# Altium schematic sheet Power-Sheet-v1.1.SchDoc
size 420 x 297 mm; SheetNumber: 1; SheetTotal: 1
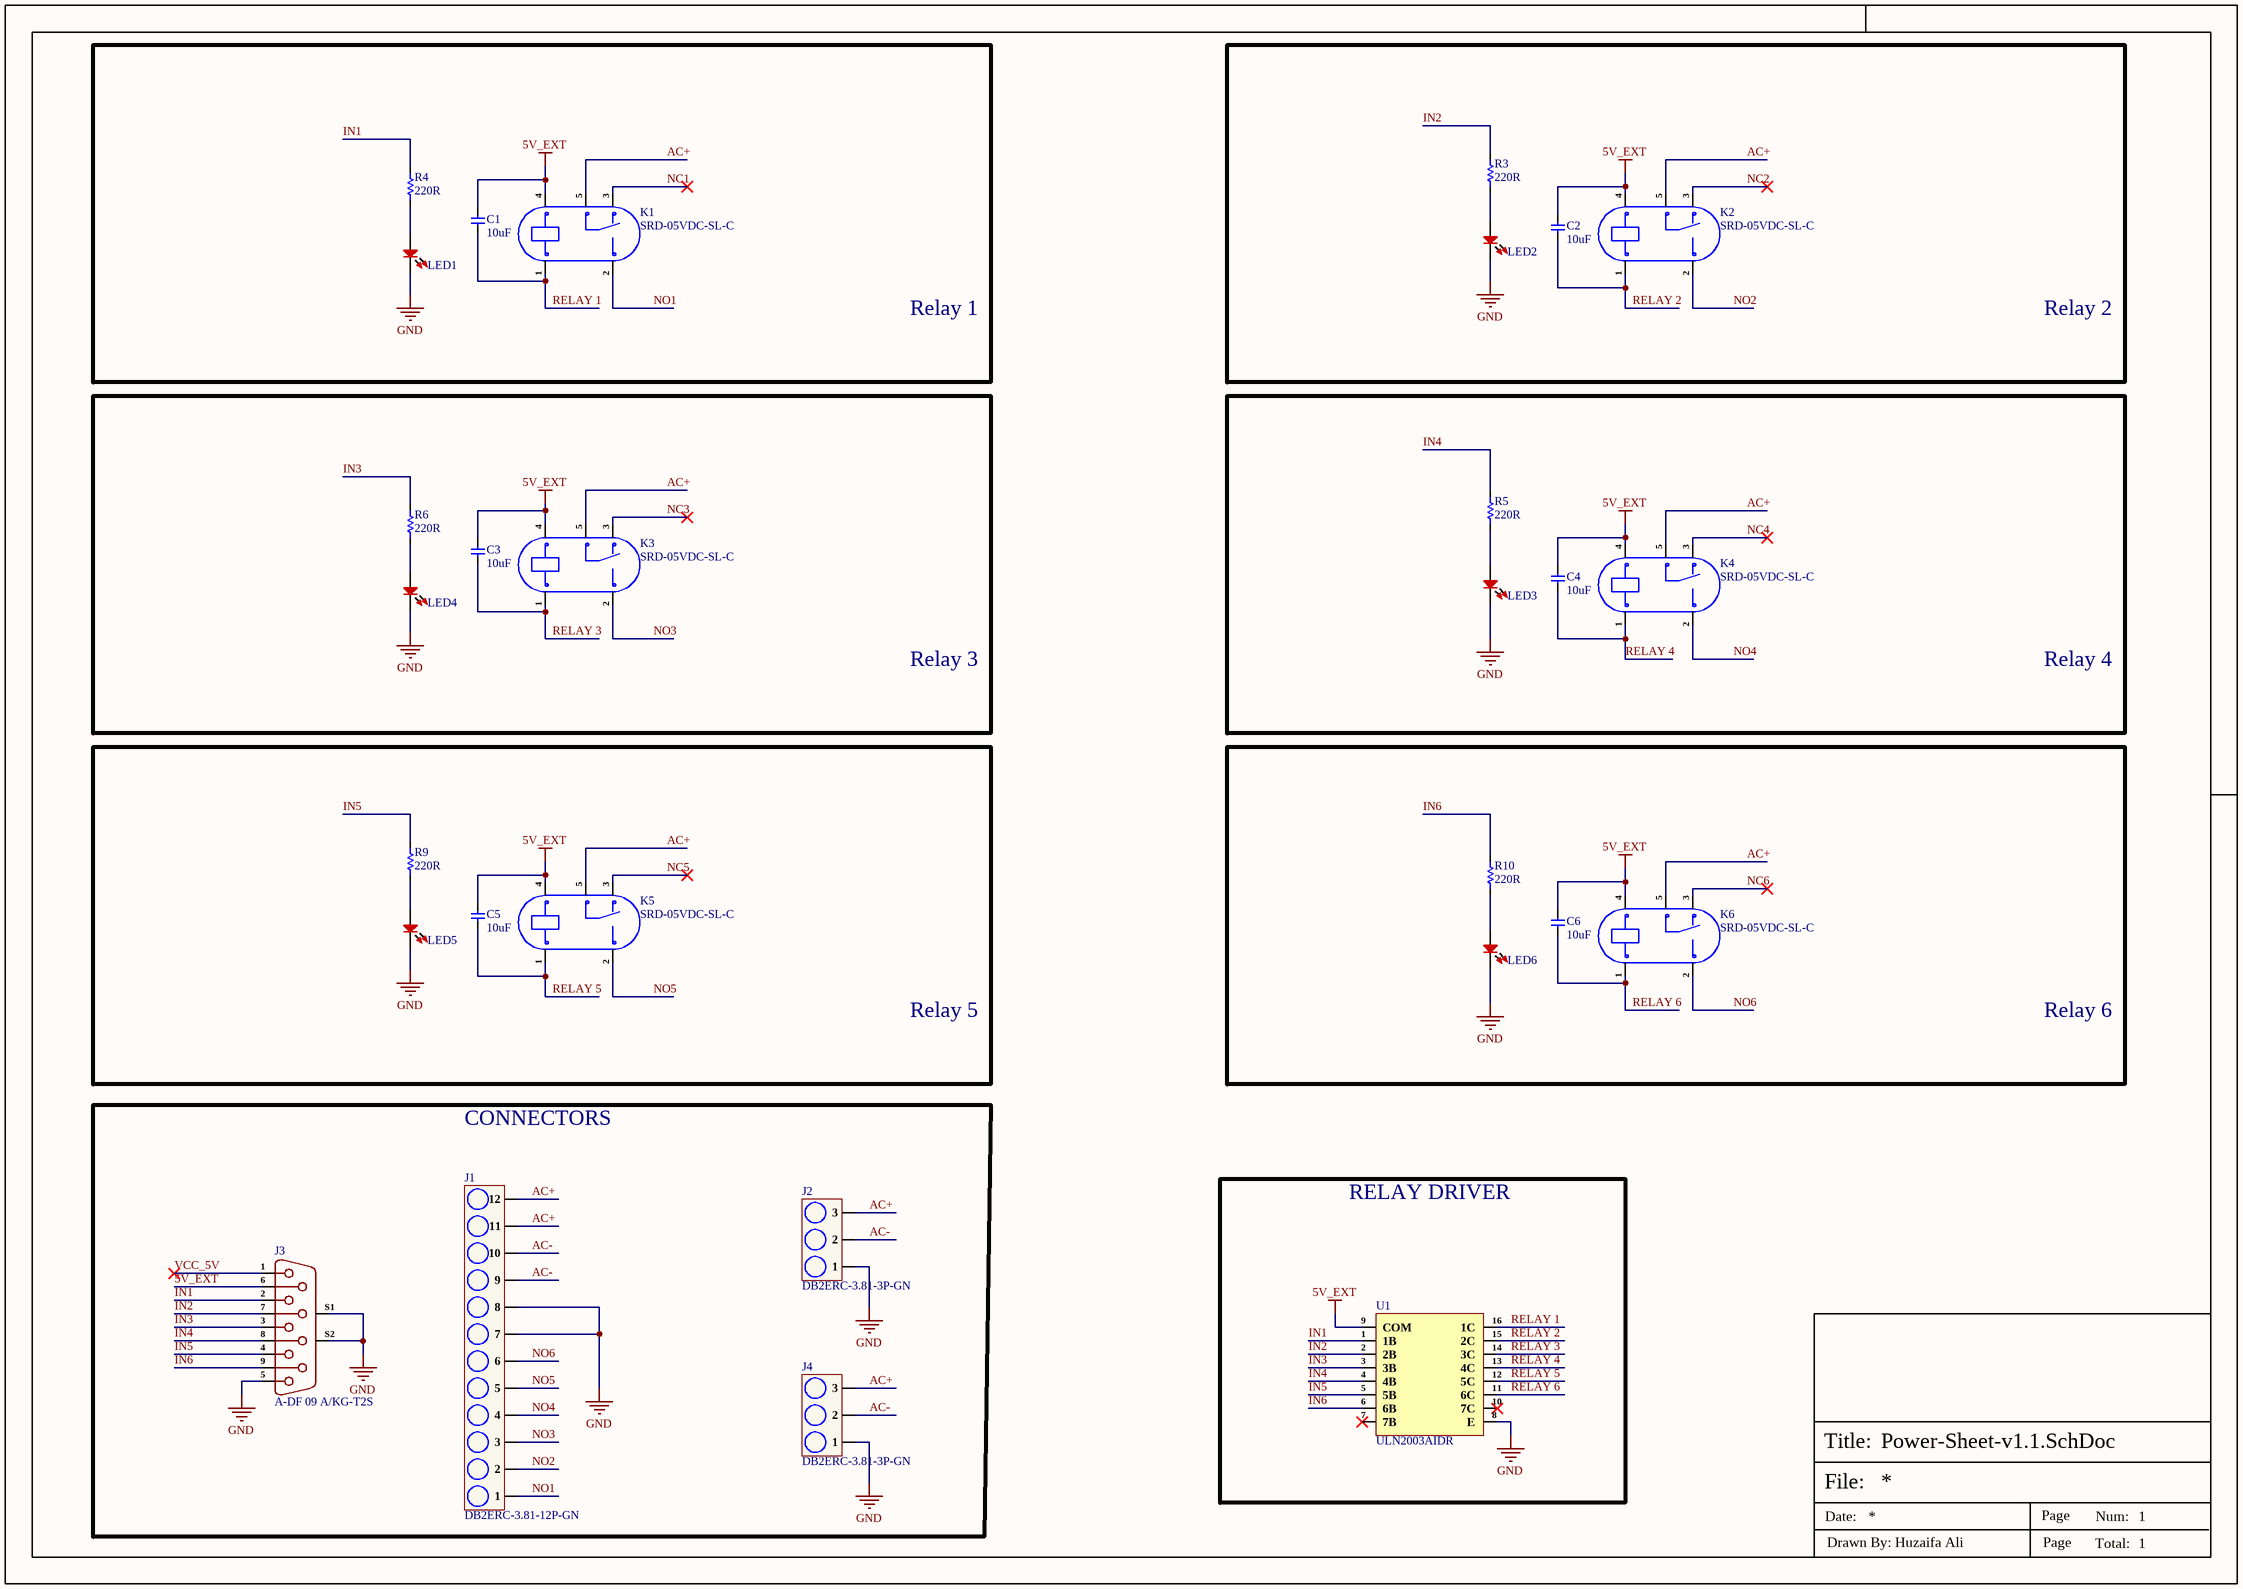
[diagram p0: Power-Sheet-v1.1.SchDoc]

## Parts
C1  10uF  [Cap-0805]
C2  10uF  [Cap-0805]
C3  10uF  [Cap-0805]
C4  10uF  [Cap-0805]
C5  10uF  [Cap-0805]
C6  10uF  [Cap-0805]
J1  DB2ERC-3.81-12P-GN  [DB2ERC-3.81-12P-GN]
J2  DB2ERC-3.81-3P-GN  [DB2ERC-3.81-3P-GN]
J3  A-DF 09 A/KG-T2S  [A-DF 09 A/KG-T2S]
J4  DB2ERC-3.81-3P-GN  [DB2ERC-3.81-3P-GN]
K1  SRD-05VDC-SL-C  [SRD-05VDC-SL-C]
K2  SRD-05VDC-SL-C  [SRD-05VDC-SL-C]
K3  SRD-05VDC-SL-C  [SRD-05VDC-SL-C]
K4  SRD-05VDC-SL-C  [SRD-05VDC-SL-C]
K5  SRD-05VDC-SL-C  [SRD-05VDC-SL-C]
K6  SRD-05VDC-SL-C  [SRD-05VDC-SL-C]
LED1  LTST-C193KRKT-5A  [LED-0603]  (value not drawn)
LED2  LTST-C193KRKT-5A  [LED-0603]  (value not drawn)
LED3  LTST-C193KRKT-5A  [LED-0603]  (value not drawn)
LED4  LTST-C193KRKT-5A  [LED-0603]  (value not drawn)
LED5  LTST-C193KRKT-5A  [LED-0603]  (value not drawn)
LED6  LTST-C193KRKT-5A  [LED-0603]  (value not drawn)
R3  220R  [Res-0603]
R4  220R  [Res-0603]
R5  220R  [Res-0603]
R6  220R  [Res-0603]
R9  220R  [Res-0603]
R10  220R  [Res-0603]
U1  ULN2003AIDR  [16-SOIC (0.154", 3.90mm Width)]

## Blocks framed on the sheet
Relay 1: C1 K1 LED1 R4
Relay 2: C2 K2 LED2 R3
Relay 3: C3 K3 LED4 R6
Relay 4: C4 K4 LED3 R5
Relay 5: C5 K5 LED5 R9
Relay 6: C6 K6 LED6 R10
CONNECTORS: J1-J4
RELAY DRIVER: U1

## Nets
5V_EXT: C1.2 C2.2 C3.2 C4.2 C5.2 C6.2 J3.6 K1.4 K2.4 K3.4 K4.4 K5.4 K6.4 U1.9(COM)
GND: J1.7 J1.8 J2.1 J3.5 J3.S1 J3.S2 J4.1 LED1.2 LED2.2 LED3.2 LED4.2 LED5.2 LED6.2 U1.8(E)
AC+: J1.11 J1.12 J2.3 J4.3 K1.5 K2.5 K3.5 K4.5 K5.5 K6.5
AC-: J1.9 J1.10 J2.2 J4.2
IN1: J3.2 R4.2 U1.1(1B)
IN2: J3.7 R3.2 U1.2(2B)
IN3: J3.3 R6.2 U1.3(3B)
IN4: J3.8 R5.2 U1.4(4B)
IN5: J3.4 R9.2 U1.5(5B)
IN6: J3.9 R10.2 U1.6(6B)
NC1: K1.3
NC2: K2.3
NC3: K3.3
NC4: K4.3
NC5: K5.3
NC6: K6.3
NO1: J1.1 K1.2
NO2: J1.2 K2.2
NO3: J1.3 K3.2
NO4: J1.4 K4.2
NO5: J1.5 K5.2
NO6: J1.6 K6.2
RELAY 1: C1.1 K1.1 U1.16(1C)
RELAY 2: C2.1 K2.1 U1.15(2C)
RELAY 3: C3.1 K3.1 U1.14(3C)
RELAY 4: C4.1 K4.1 U1.13(4C)
RELAY 5: C5.1 K5.1 U1.12(5C)
RELAY 6: C6.1 K6.1 U1.11(6C)
VCC_5V: J3.1
NetLED1_1: LED1.1 R4.1
NetLED2_1: LED2.1 R3.1
NetLED3_1: LED3.1 R5.1
NetLED4_1: LED4.1 R6.1
NetLED5_1: LED5.1 R9.1
NetLED6_1: LED6.1 R10.1

Not connected (* = marked no-connect by the designer): U1 7(7B)* 10(7C)*

## Notes on the sheet
- File:
- Title:
- Date:
- Page
- Num:
- Total:
- Drawn By: Huzaifa Ali

## Library data of the parts
C1-C6 = GRM21BR61H106ME43L: CAP CER 10UF 50V X5R 0805; Manufacturer: Murata; Supplier 1: Digi-Key; Manufacturer Part Number: GRM21BR61H106ME43L; RoHS: Yes; Category: Ceramic Capacitors; Stock 1: 26; Pricing 1: 1=0.44000, 10=0.30700, 50=0.21500, 100=0.18420, 500=0.13818, 1000=0.11668 (USD); Supplier Part Number 1: 490-18664-1-ND; LCSC Part Number: C2190942
J1 = DB2ERC-3.81-12P-GN: 250V 10A 12 Bend -40℃~+105℃ 1 3.81mm 1x12P Green Board Edge/Receptacle-Close Push-Pull,P=3.81mm Pluggable System Terminal Block ROHS; Manufacturer: DORABO; Manufacturer Part Number: DB2ERC-3.81-12P-GN; Package: Push-Pull,P=3.81mm; LCSC Part Number: C395728; Item Type: Terminal Block; ComponentLink1Description: LCSC; ComponentLink1URL: https://www.lcsc.com/product-detail/Pluggable-System-Terminal-Block_DORABO-DB2ERC-3-81-12P-GN_C395728.html
J2 J4 = DB2ERC-3.81-3P-GN: 250V 10A 3 Bend -40℃~+105℃ 1 3.81mm 1x3P Green Board Edge/Receptacle-Close Push-Pull,P=3.81mm Pluggable System Terminal Block ROHS; Manufacturer: DORABO; Manufacturer Part Number: DB2ERC-3.81-3P-GN; Package: Push-Pull,P=3.81mm; LCSC Part Number: C395690; Item Type: Terminal Block; ComponentLink1Description: LCSC; ComponentLink1URL: https://www.lcsc.com/product-detail/Pluggable-System-Terminal-Block_DORABO-DB2ERC-3-81-3P-GN_C395690.html
J3 = A-DF 09 A/KG-T2S: CONN D-SUB RCPT 9POS R/A SLDR; Manufacturer: Assmann; Item Type: D-Sub Connectors; Number of Contacts: 9NUMBER; Supplier: Digikey; Supplier Part Number: AE10921-ND; Manufacturer Part Number: A-DF 09 A/KG-T2S; RoHS: Yes; Stock: 23990; Pricing: 1=0.78, 10=0.661, 25=0.6336, 40=0.62025, 90=0.59322, 270=0.53933, 450=0.4854, 990=0.43147, 2430=0.39102 (USD); Height: 12.68mm; Lead Free: 5697LeadFree; ComponentLink1URL: https://datasheet.ciiva.com/26927/getdatasheetpartid-755627-26927441.pdf?src-supplier=Verical; ComponentLink1Description: https://datasheet.ciiva.com/26927/getdatasheetpartid-755627-26927441.pdf?src-supplier=Verical
K1-K6 = SRD-05VDC-SL-C: 250V@AC 5V 15A SPDT (1 Form C) Plugin,15.6x19.2mm Power Relays ROHS; Manufacturer: Ningbo Songle Relay; Manufacturer Part Number: SRD-05VDC-SL-C; Package: Plugin,15.6x19.2mm; LCSC Part Number: C35449; Item Type: Relays; ComponentLink1Description: LCSC; ComponentLink1URL: https://www.lcsc.com/product-detail/Power-Relays_Ningbo-Songle-Relay-SRD-05VDC-SL-C_C35449.html
LED1-LED6 = LTST-C193KRKT-5A: LED RED CLEAR CHIP SMD; Manufacturer: Vishay Lite-On; Item Type: LEDs; Lens Color: Colorless; Viewing Angle: 130°; Lens Style: Flat,Diffused,Colorless,Rectangular,Clear; Luminous Intensity: 45mcd; Forward Current: 30mA; Forward Voltage: 2.3V; Test Current: 5mA; Dominant Wavelength: 631nm; Number of Elements: 1; Power Dissipation: 75mW; Reverse Voltage: 5V; Lens Size: 0.8mm; Supplier: Digikey; Supplier Part Number: 160-1830-1-ND; Manufacturer Part Number: LTST-C193KRKT-5A; RoHS: Yes; Stock: 241564; Pricing: 1=0.39, 10=0.211, 100=0.0981, 500=0.0906, 1000=0.07097, 2000=0.06946 (USD); Mounting Technology: Surface Mount; Case/Package: 0603; Pins: 2; Color: Red; Case Code (Metric): 1608; Case Code (Imperial): 0603; Min Operating Temperature: -55°C; Max Operating Temperature: 85°C; Package Quantity: 3000; Packaging: Tape and Reel; Illumination Color: Red; Lens Transparency: Clear; Number of LEDs: 1; Series: -; Wavelength: 631nm; Length: 1.6mm; Width: 0.8mm; Height: 0.45mm; Depth: 0.8mm; Radiation Hardening: No; Lead Free: Lead Free; RoHS Compliant: Yes; ComponentLink1URL: https://datasheet.ciiva.com/11775/0900766b80dc0551-11775612.pdf?src-supplier=Rs; ComponentLink1Description: https://datasheet.ciiva.com/11775/0900766b80dc0551-11775612.pdf?src-supplier=Rs; ComponentLink2URL: https://datasheet.ciiva.com/4689/100-ltst-c193krkt-5a-61179-4689123.pdf?src-supplier=Mouser; ComponentLink2Description: https://datasheet.ciiva.com/4689/100-ltst-c193krkt-5a-61179-4689123.pdf?src-supplier=Mouser; ComponentLink3URL: https://datasheet.ciiva.com/16210/ltst-c193krkt-5a-16210822.pdf?src-supplier=Future+Electronics; ComponentLink3Description: https://datasheet.ciiva.com/16210/ltst-c193krkt-5a-16210822.pdf?src-supplier=Future+Electronics; ComponentLink4URL: https://datasheet.ciiva.com/2110/s-110-ltst-c193krkt-5a-2110272.pdf?src-supplier=Digikey; ComponentLink4Description: https://datasheet.ciiva.com/2110/s-110-ltst-c193krkt-5a-2110272.pdf?src-supplier=Digikey
R3-R6 R9 R10 = CRCW0603220RFKEA: RES SMD 220 OHM 1% 1/10W 0603; Item Type: Resistor; Temperature Coefficient: 100ppm/°C; Max Power Dissipation: 100mW; Voltage Rating (DC): 75V; LCSC Part Number: C844757; ComponentLink1Description: LCSC; Supplier: Mouser; Supplier Part Number: 71-CRCW0603-220-E3; RoHS: Yes; Category: Chip SMD Resistors; Stock: 40706; Pricing: 1=0.1, 10=0.017, 50=0.017, 100=0.01, 1000=0.008, 10000=0.004 (USD); Case/Package: 0603; Contact Plating: Tin; Case Code (Metric): 1608; Case Code (Imperial): 0603; Weight: 7.1E-05oz; Min Operating Temperature: -55°C; Max Operating Temperature: 155°C; Value: 220R; Tolerance: 1%; Packaging: Tape and Reel; Series: CRCW; Resistor Type: Thick Film; Number of Terminations: 2; Termination: SMD/SMT; Power Rating: 100mW; Voltage Rating: 75V; Package Quantity: 5000; Features: Automotive AEC-Q200; Resistance Tolerance: 1%; Technology: THICK FILM; Construction: Rectangular; Length: 1.55mm; Width: 0.85mm; Height: 0.45mm; Depth: 0.85mm; Ratings: AEC-Q200; Radiation Hardening: No; RoHS Compliant: Yes; Lead Free: Lead Free; Reach SVHC Compliant: Unknown; Military Standard: Not; ComponentLink2URL: https://datasheet.ciiva.com/11810/0900766b80d98afc-11810631.pdf?src-supplier=Rs; ComponentLink2Description: https://datasheet.ciiva.com/11810/0900766b80d98afc-11810631.pdf?src-supplier=Rs; ComponentLink3URL: https://datasheet.ciiva.com/8339/dcrcwe3-8339957.pdf?src-supplier=Avnet; ComponentLink3Description: https://datasheet.ciiva.com/8339/dcrcwe3-8339957.pdf?src-supplier=Avnet; ComponentLink4URL: https://datasheet.ciiva.com/16222/dcrcwe3-16222278.pdf?src-supplier=Future+Electronics; ComponentLink4Description: https://datasheet.ciiva.com/16222/dcrcwe3-16222278.pdf?src-supplier=Future+Electronics; ComponentLink5URL: https://datasheet.ciiva.com/7777/1697337-7777301.pdf?src-supplier=Element14; ComponentLink5Description: https://datasheet.ciiva.com/7777/1697337-7777301.pdf?src-supplier=Element14; ComponentLink6URL: https://datasheet.ciiva.com/16763/70201119-16763287.pdf?src-supplier=Allied+Electronics; ComponentLink6Description: https://datasheet.ciiva.com/16763/70201119-16763287.pdf?src-supplier=Allied+Electronics; ComponentLink7URL: https://datasheet.ciiva.com/2466/dcrcwe3-2466464.pdf?src-supplier=Digi-Key; ComponentLink7Description: https://datasheet.ciiva.com/2466/dcrcwe3-2466464.pdf?src-supplier=Digi-Key; ComponentLink8URL: https://datasheet.ciiva.com/2466/dcrcwe3-2466465.pdf?src-supplier=Digi-Key; ComponentLink8Description: https://datasheet.ciiva.com/2466/dcrcwe3-2466465.pdf?src-supplier=Digi-Key; ComponentLink9URL: https://datasheet.ciiva.com/2466/dcrcwe3-2466466.pdf?src-supplier=Digi-Key; ComponentLink9Description: https://datasheet.ciiva.com/2466/dcrcwe3-2466466.pdf?src-supplier=Digi-Key; ComponentLink10URL: https://datasheet.ciiva.com/7777/1720486-7777551.pdf?src-supplier=Element14; ComponentLink10Description: https://datasheet.ciiva.com/7777/1720486-7777551.pdf?src-supplier=Element14; ComponentLink11URL: https://datasheet.ciiva.com/26316/fld-crcw-e3-data-en-26316574.pdf?src-supplier=Distrelec; ComponentLink11Description: https://datasheet.ciiva.com/26316/fld-crcw-e3-data-en-26316574.pdf?src-supplier=Distrelec; ComponentLink12URL: https://datasheet.ciiva.com/5550/dcrcwe3-109170-5550773.pdf?src-supplier=Mouser; ComponentLink12Description: https://datasheet.ciiva.com/5550/dcrcwe3-109170-5550773.pdf?src-supplier=Mouser; ComponentLink13URL: https://datasheet.ciiva.com/15159/getdatasheetpartid-45816-15159565.pdf?src-supplier=Verical; ComponentLink13Description: https://datasheet.ciiva.com/15159/getdatasheetpartid-45816-15159565.pdf?src-supplier=Verical
U1 = ULN2003AIDR: IC PWR RELAY 7NPN 1:1 16SOIC; Manufacturer: Texas Instruments; Supplier: Mouser; Supplier Part Number: 595-ULN2003AIDR; Manufacturer Part Number: ULN2003AIDR; RoHS: Yes; Item Type: IC; Stock: 2012; Pricing: 1=0.66, 10=0.589, 50=0.589, 100=0.402, 1000=0.285, 10000=0.232 (USD); ComponentLink1URL: https://datasheet.ciiva.com/15139/getdatasheetpartid-47948-15139878.pdf?src-supplier=Verical; ComponentLink1Description: https://datasheet.ciiva.com/15139/getdatasheetpartid-47948-15139878.pdf?src-supplier=Verical; ComponentLink2URL: https://datasheet.ciiva.com/14424/ulq2003a-14424030.pdf?src-supplier=Avnet; ComponentLink2Description: https://datasheet.ciiva.com/14424/ulq2003a-14424030.pdf?src-supplier=Avnet; ComponentLink3URL: https://datasheet.ciiva.com/1700/uln2003ai-1700820.pdf?src-supplier=Digikey; ComponentLink3Description: https://datasheet.ciiva.com/1700/uln2003ai-1700820.pdf?src-supplier=Digikey; ComponentLink4URL: https://datasheet.ciiva.com/1700/uln2003ai-1700821.pdf?src-supplier=Digikey; ComponentLink4Description: https://datasheet.ciiva.com/1700/uln2003ai-1700821.pdf?src-supplier=Digikey; ComponentLink5URL: https://datasheet.ciiva.com/1700/uln2003ai-1700822.pdf?src-supplier=Digikey; ComponentLink5Description: https://datasheet.ciiva.com/1700/uln2003ai-1700822.pdf?src-supplier=Digikey